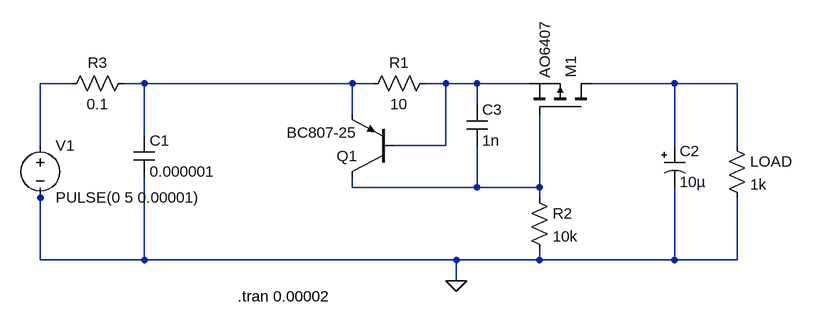
[diagram p0: schematic inrush_current_limiter.asc]
inrush_current_limiter.asc, the LTspice schematic file:
Version 4
SHEET 1 880 680
WIRE -416 48 -464 48
WIRE -304 48 -336 48
WIRE 16 48 -304 48
WIRE 48 48 16 48
WIRE 160 48 128 48
WIRE 208 48 160 48
WIRE 288 48 208 48
WIRE 512 48 384 48
WIRE 608 48 512 48
WIRE 208 80 208 48
WIRE 16 96 16 48
WIRE -304 128 -304 48
WIRE -464 144 -464 48
WIRE 160 144 160 48
WIRE 160 144 80 144
WIRE 512 144 512 48
WIRE 608 144 608 48
WIRE 16 208 16 192
WIRE 208 208 208 144
WIRE 208 208 16 208
WIRE 304 208 304 96
WIRE 304 208 208 208
WIRE -464 224 -464 208
WIRE 304 224 304 208
WIRE -464 320 -464 224
WIRE -304 320 -304 192
WIRE -304 320 -464 320
WIRE 176 320 -304 320
WIRE 304 320 304 304
WIRE 304 320 176 320
WIRE 512 320 512 208
WIRE 512 320 304 320
WIRE 608 320 608 224
WIRE 608 320 512 320
WIRE 176 352 176 320
FLAG 176 352 0
SYMBOL res 32 64 R270
WINDOW 0 32 56 VTop 2
WINDOW 3 0 56 VBottom 2
SYMATTR InstName R1
SYMATTR Value 10
SYMBOL res 288 208 R0
SYMATTR InstName R2
SYMATTR Value 10k
SYMBOL pmos 384 96 M270
SYMATTR InstName M1
SYMATTR Value AO6407
SYMBOL polcap 496 144 R0
WINDOW 3 24 56 Left 2
SYMATTR Value 10µ
SYMATTR InstName C2
SYMATTR Description Capacitor
SYMATTR Type cap
SYMATTR SpiceLine V=6.3 Irms=0 Rser=4 Lser=0 mfg="AVX" pn="TAJA106M006" type="Tantalum"
SYMBOL voltage -464 128 R0
WINDOW 123 0 0 Left 2
WINDOW 39 24 124 Left 2
SYMATTR InstName V1
SYMATTR Value PULSE(0 5 0.00001)
SYMBOL pnp 80 192 R180
SYMATTR InstName Q1
SYMATTR Value BC807-25
SYMBOL res 592 128 R0
SYMATTR InstName LOAD
SYMATTR Value 1k
SYMBOL cap -320 128 R0
SYMATTR InstName C1
SYMATTR Value 0.000001
SYMBOL res -432 64 R270
WINDOW 0 32 56 VTop 2
WINDOW 3 0 56 VBottom 2
SYMATTR InstName R3
SYMATTR Value 0.1
SYMBOL cap 192 80 R0
SYMATTR InstName C3
SYMATTR Value 1n
TEXT -160 376 Left 2 !.tran 0.00002

The netlist it stands for:
* inrush_current_limiter.asc
R1 N002 N003 10
R2 N005 0 10k
M1 N004 N005 N003 N003 AO6407
C2 N004 0 10µ V=6.3 Irms=0 Rser=4 Lser=0 mfg="AVX" pn="TAJA106M006" type="Tantalum"
V1 N001 0 PULSE(0 5 0.00001)
Q1 N005 N003 N002 0 BC807-25
R§LOAD N004 0 1k
C1 N002 0 0.000001
R3 N001 N002 0.1
C3 N003 N005 1n
.model NPN NPN
.model PNP PNP
.lib standard.bjt
.model NMOS NMOS
.model PMOS PMOS
.lib standard.mos
.tran 0.00002
.backanno
.end